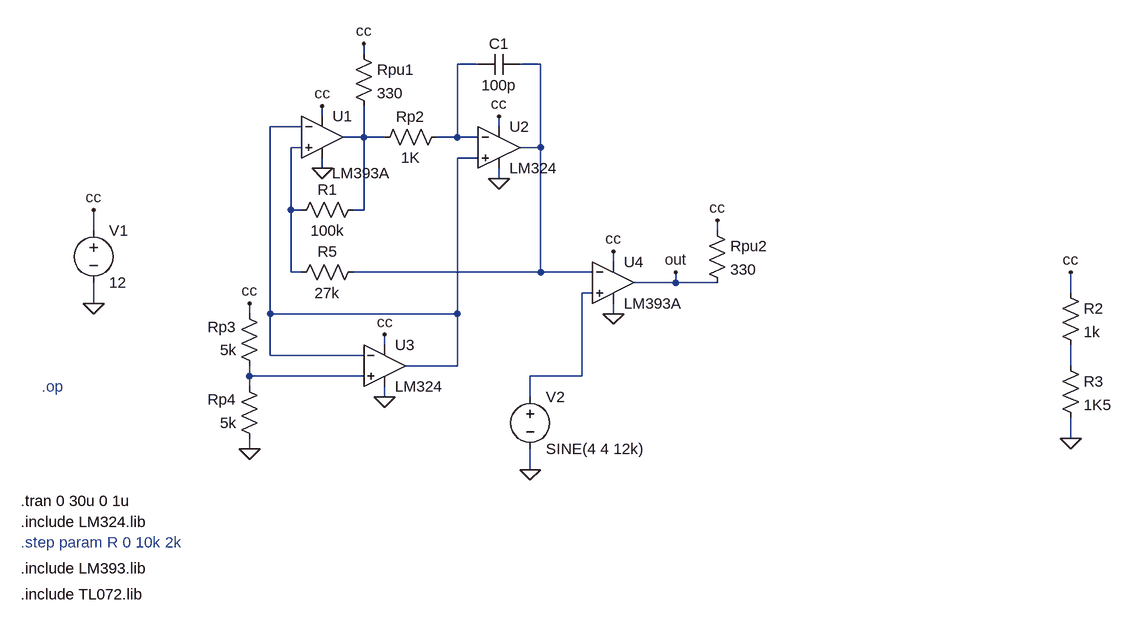
[diagram p0: schematic pwm_324.asc]
pwm_324.asc, the LTspice schematic file:
Version 4.1
SHEET 1 908 832
WIRE -256 -16 -256 -32
WIRE -80 0 -112 0
WIRE 16 0 -16 0
WIRE -320 80 -320 64
WIRE -352 96 -400 96
WIRE -48 96 -48 80
WIRE -256 112 -256 64
WIRE -256 112 -288 112
WIRE -224 112 -256 112
WIRE -112 112 -112 0
WIRE -112 112 -144 112
WIRE -80 112 -112 112
WIRE -352 128 -368 128
WIRE 16 128 16 0
WIRE 16 128 -16 128
WIRE -80 144 -112 144
WIRE -320 160 -320 144
WIRE -48 176 -48 160
WIRE -368 224 -368 128
WIRE -352 224 -368 224
WIRE -256 224 -256 112
WIRE -256 224 -272 224
WIRE -672 256 -672 224
WIRE 288 256 288 240
WIRE 128 304 128 288
WIRE -368 320 -368 224
WIRE -352 320 -368 320
WIRE 16 320 16 128
WIRE 16 320 -272 320
WIRE 96 320 16 320
WIRE 224 336 224 320
WIRE 224 336 160 336
WIRE 288 336 224 336
WIRE 96 352 80 352
WIRE 832 352 832 320
WIRE -672 368 -672 336
WIRE -432 384 -432 368
WIRE -400 384 -400 96
WIRE -112 384 -112 144
WIRE -112 384 -400 384
WIRE 128 384 128 368
WIRE -224 432 -224 416
WIRE -400 448 -400 384
WIRE -256 448 -400 448
WIRE -112 464 -112 384
WIRE -112 464 -192 464
WIRE 832 464 832 432
WIRE -432 480 -432 464
WIRE -256 480 -432 480
WIRE 80 480 80 352
WIRE 80 480 0 480
WIRE -432 496 -432 480
WIRE -224 512 -224 496
WIRE 0 512 0 480
WIRE 832 576 832 544
WIRE -432 592 -432 576
WIRE 0 624 0 592
FLAG -320 160 0
FLAG -48 176 0
FLAG -224 512 0
FLAG -320 64 cc
FLAG -48 80 cc
FLAG -224 416 cc
FLAG -432 592 0
FLAG -432 368 cc
FLAG -672 224 cc
FLAG -672 368 0
FLAG 224 320 out
FLAG 128 288 cc
FLAG 128 384 0
FLAG -256 -32 cc
FLAG 288 240 cc
FLAG 832 576 0
FLAG 832 320 cc
FLAG 0 624 0
SYMBOL res -256 208 R90
WINDOW 0 0 56 VBottom 2
WINDOW 3 32 56 VTop 2
SYMATTR InstName R1
SYMATTR Value 100k
SYMBOL res -128 96 R90
WINDOW 0 0 56 VBottom 2
WINDOW 3 32 56 VTop 2
SYMATTR InstName Rp2
SYMATTR Value 1K
SYMBOL res -416 480 R180
WINDOW 0 36 76 Left 2
WINDOW 3 36 40 Left 2
SYMATTR InstName Rp3
SYMATTR Value 5k
SYMBOL res -416 592 R180
WINDOW 0 36 76 Left 2
WINDOW 3 36 40 Left 2
SYMATTR InstName Rp4
SYMATTR Value 5k
SYMBOL res -256 304 R90
WINDOW 0 0 56 VBottom 2
WINDOW 3 32 56 VTop 2
SYMATTR InstName R5
SYMATTR Value 27k
SYMBOL voltage -672 240 R0
SYMATTR InstName V1
SYMATTR Value 12
SYMBOL cap -16 -16 R90
WINDOW 0 0 32 VBottom 2
WINDOW 3 32 32 VTop 2
SYMATTR InstName C1
SYMATTR Value 100p
SYMBOL OpAmps\\opamp2 -320 48 R0
WINDOW 3 15 119 Left 2
SYMATTR Value LM393A
SYMATTR InstName U1
SYMBOL OpAmps\\opamp2 -48 64 R0
SYMATTR InstName U2
SYMATTR Value LM324
SYMBOL OpAmps\\opamp2 -224 400 R0
SYMATTR InstName U3
SYMATTR Value LM324
SYMBOL OpAmps\\opamp2 128 272 R0
SYMATTR InstName U4
SYMATTR Value LM393A
SYMBOL res -272 -32 R0
SYMATTR InstName Rpu1
SYMATTR Value 330
SYMBOL res 272 240 R0
SYMATTR InstName Rpu2
SYMATTR Value 330
SYMBOL res 816 336 R0
SYMATTR InstName R2
SYMATTR Value 1k
SYMBOL res 816 448 R0
SYMATTR InstName R3
SYMATTR Value 1K5
SYMBOL voltage 0 496 R0
WINDOW 123 0 0 Left 0
WINDOW 39 0 0 Left 0
SYMATTR InstName V2
SYMATTR Value SINE(4 4 12k)
TEXT -784 736 Left 2 ;.step param R 0 10k 2k
TEXT -752 496 Left 2 ;.op
TEXT -784 672 Left 2 !.tran 0 30u 0 1u
TEXT -784 704 Left 2 !.include LM324.lib
TEXT -784 776 Left 2 !.include LM393.lib
TEXT -784 816 Left 2 !.include TL072.lib

The netlist it stands for:
* pwm_324.asc
R1 N004 N005 100k
Rp2 N001 N004 1K
Rp3 N008 cc 5k
Rp4 0 N008 5k
R5 N002 N005 27k
V1 cc 0 12
C1 N002 N001 100p
X§U1 N005 N003 cc 0 N004 LM393A  ; pins In+ In- V+ V- OUT
X§U2 N003 N001 cc 0 N002 LM324  ; pins In+ In- V+ V- OUT
X§U3 N008 N003 cc 0 N003 LM324  ; pins In+ In- V+ V- OUT
X§U4 N006 N002 cc 0 out LM393A  ; pins In+ In- V+ V- OUT
Rpu1 cc N004 330
Rpu2 cc out 330
R2 cc N007 1k
R3 N007 0 1K5
V2 N006 0 SINE(4 4 12k)
* .step param R 0 10k 2k
* .op
.tran 0 30u 0 1u
.include LM324.lib
.include LM393.lib
.include TL072.lib
.backanno
.end